# EasyEDA Pro project BMS-Mainboard.epro, board PCB2
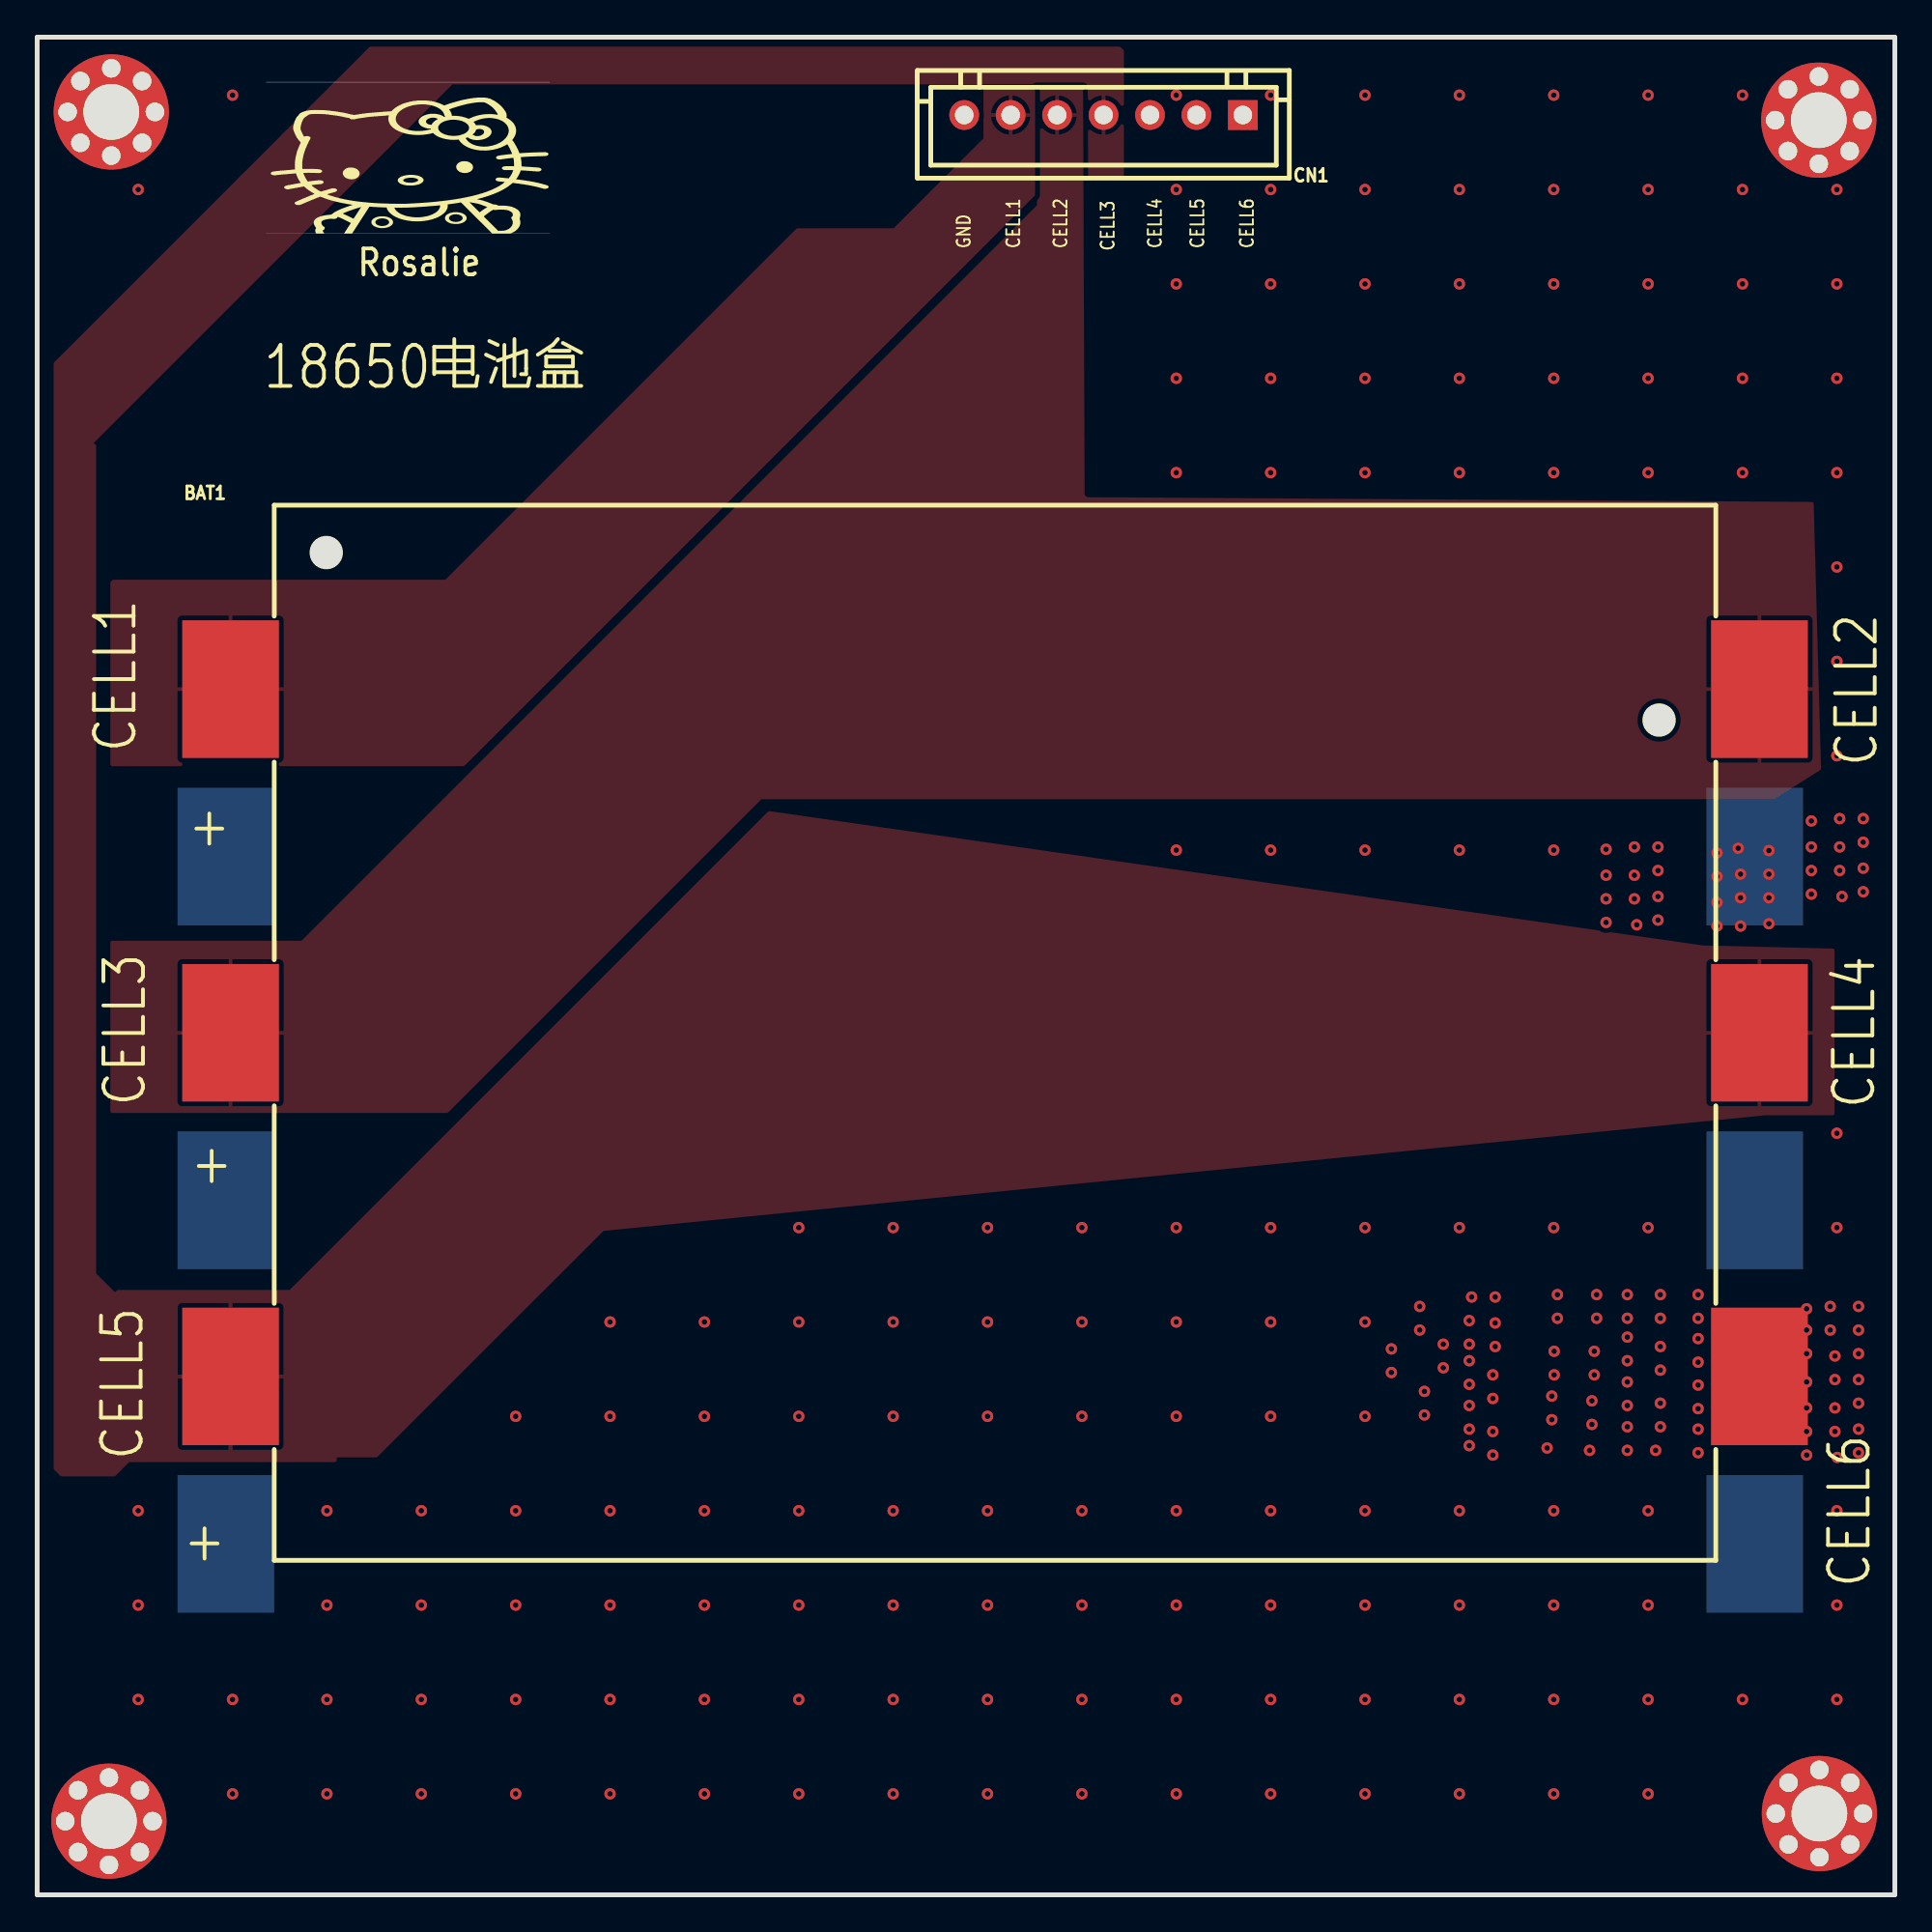
[diagram p9: board, top side]
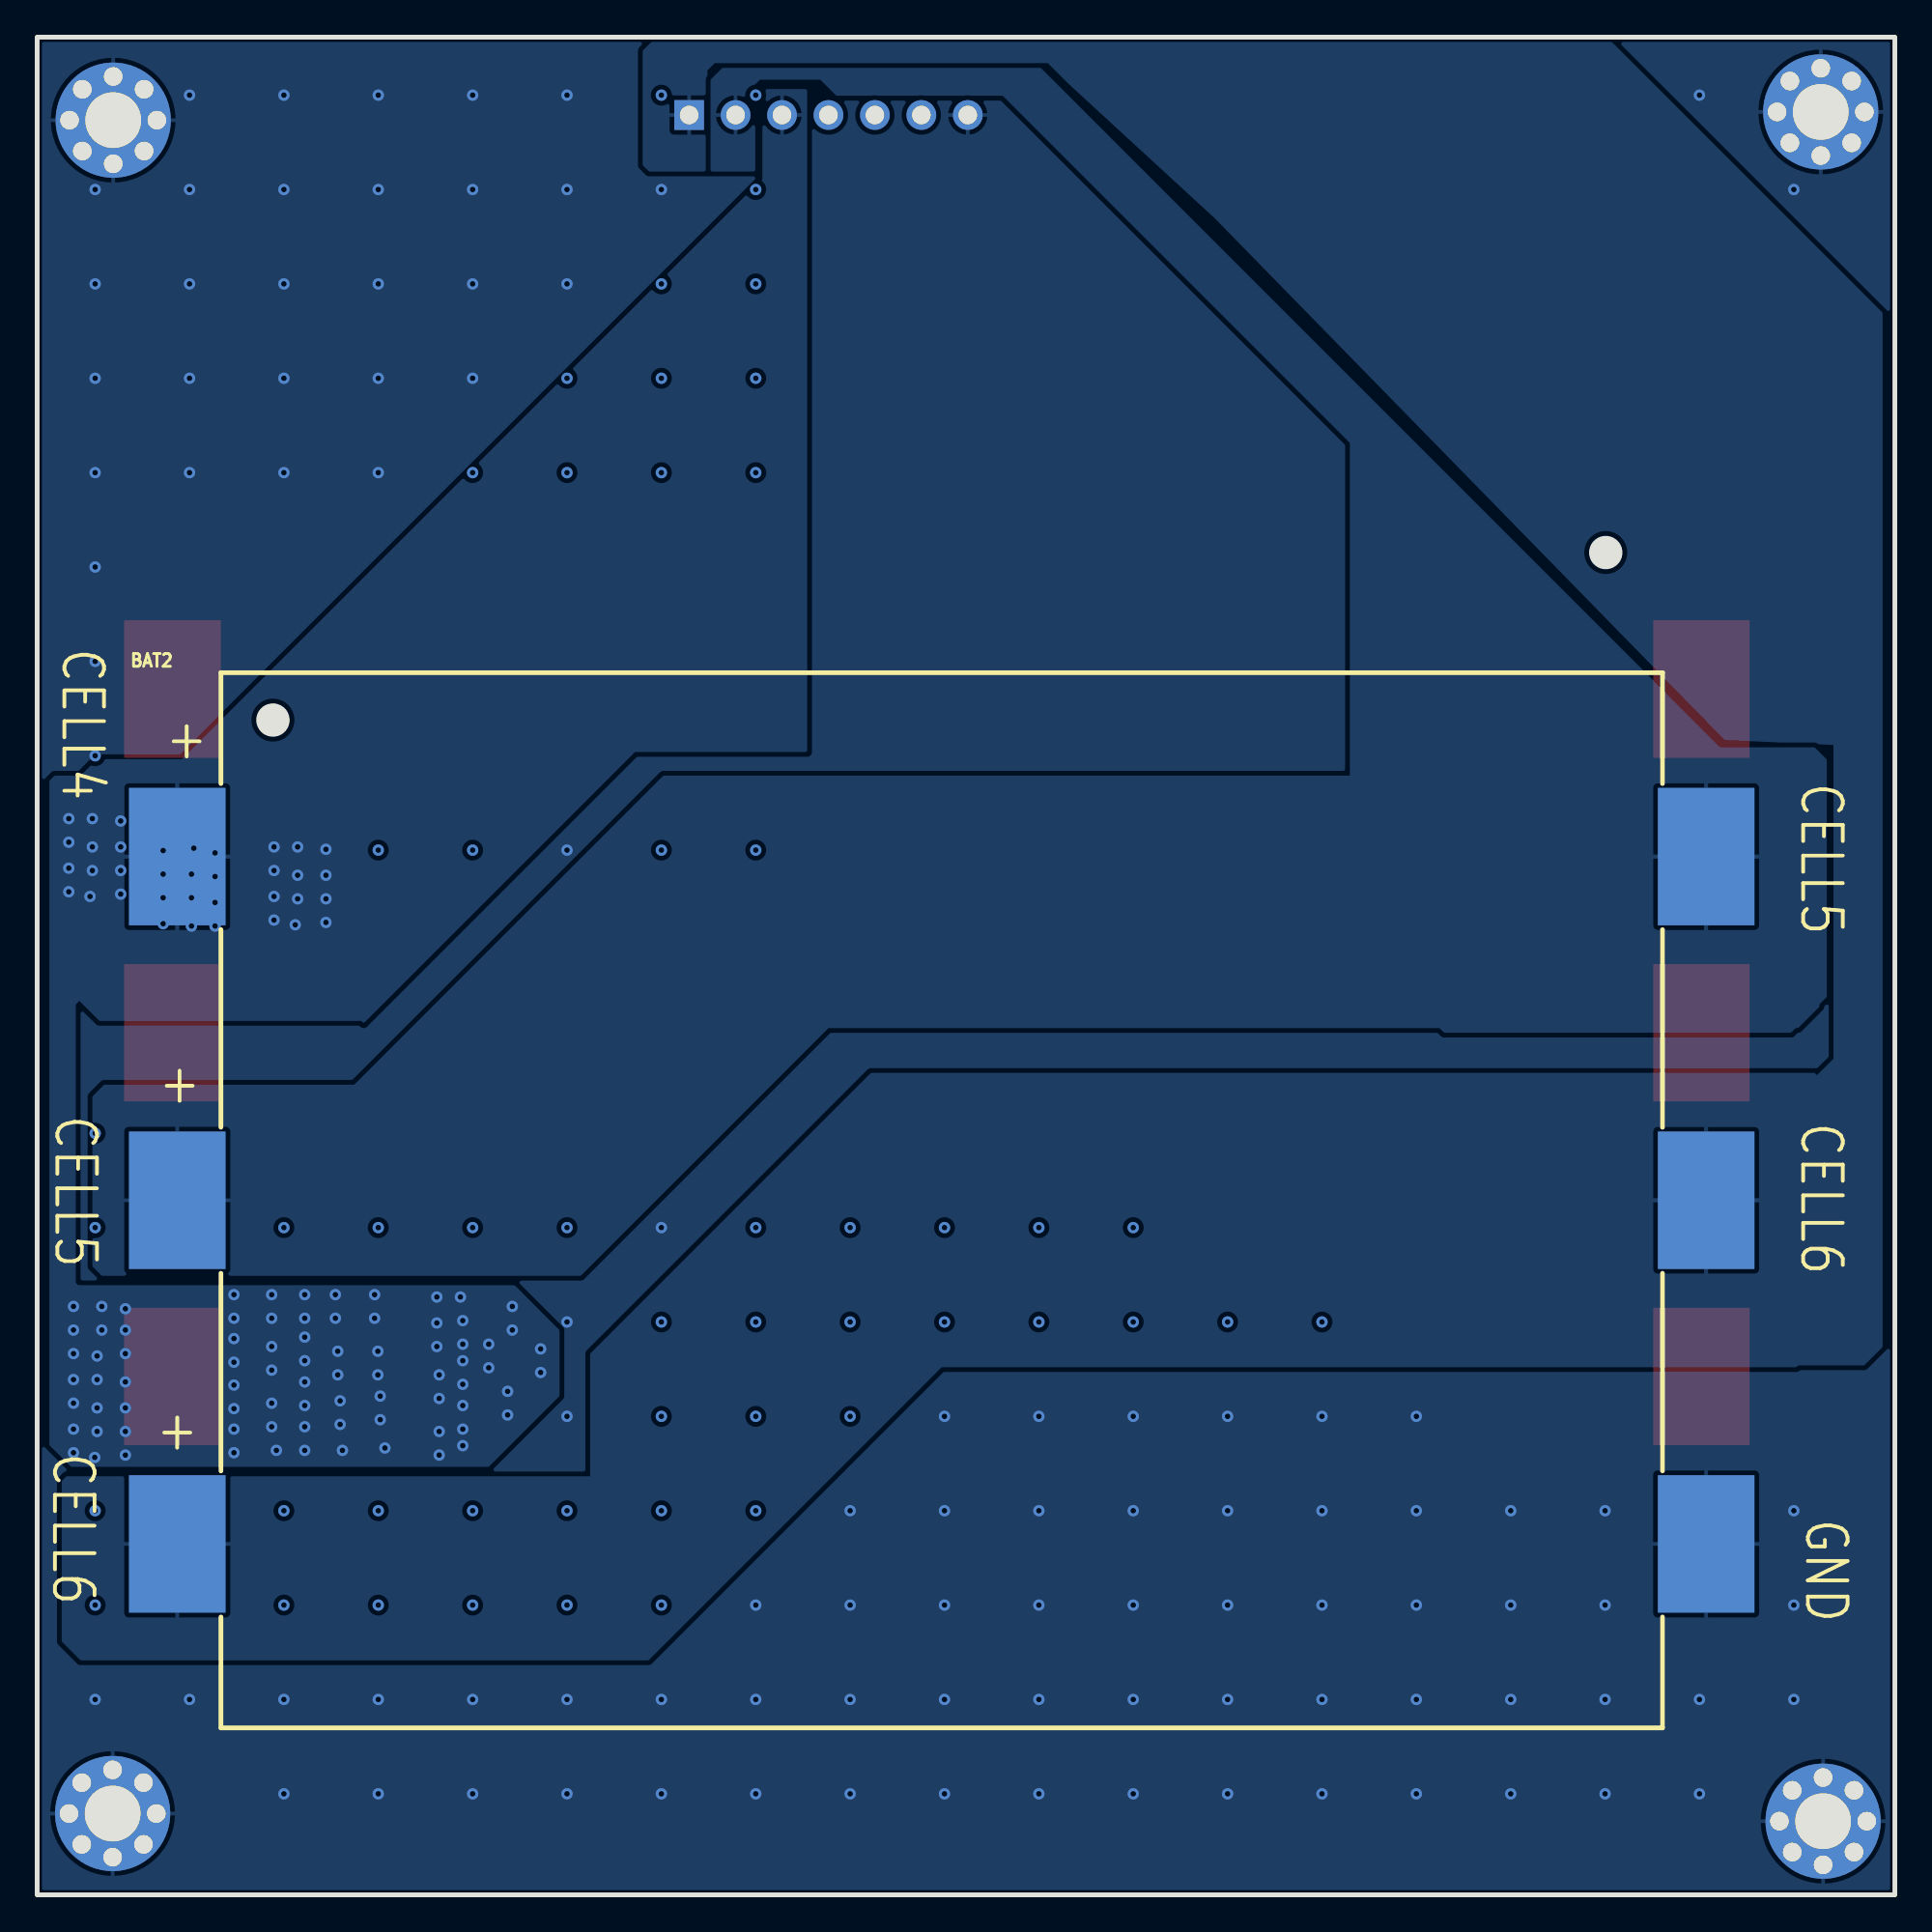
[diagram p10: board, bottom side, seen from below]

Outline 100 x 100 mm; copper layers: Top Layer, Bottom Layer. Coordinates in mm from the lower left corner of the outline.
Outline path: rectangle 0,100 100,0
Stack: Top Layer 0.035mm / Dielectric1 1.51mm FR4 er 4.5 / Bottom Layer 0.035mm

## Design rules (mm)
spacing copperThickness1oz (default): track to track 0.102, other pairs 0.152 to 0.3
spacing copperThickness2oz: track to track 0.203, other pairs 0.152 to 0.3
track width copperThickness1oz (default): min 0.127, default 0.254, max 2.54
track width copperThickness2oz: min 0.203, default 0.254, max 2.54
differential pair differentialPair (default): width min 0.127, default 0.254, max 2.54; gap min 0.152, default 0.152
net CELL1 uses copperRegion
net CELL2 uses copperRegion
net CELL3 uses copperRegion
net CELL4 uses copperRegion
net CELL5 uses copperRegion
net CELL6 uses copperRegion
net GND uses copperRegion

## Placement (name value [footprint] x y rotation side)
BAT1  BH-18650-B5BA016  [BAT-SMD_BH-18650-B5BA016]  51.56 46.41 0 top
BAT2  BH-18650-B5BA016  [BAT-SMD_BH-18650-B5BA016]  51.31 37.39 180 bottom
CN1  ZX-XH2.54-7PZZ-GW  [CONN-TH_7P-P2.50_HCTL_XH-7A]  57.4 95.81 180 top
J1  HDR-M-2.54_1x1  [定位孔]  3.86 3.97 0 top
J2  HDR-M-2.54_1x1  [定位孔]  95.94 4.38 0 top
J3  HDR-M-2.54_1x1  [定位孔]  3.99 95.97 0 top
J4  HDR-M-2.54_1x1  [定位孔]  95.91 95.53 0 top

## Footprints (pads in the part's own frame, mm; a bottom-side part is the same pattern mirrored in y, then rotated)
BAT-SMD_BH-18650-B5BA016
  rect 5.2x7.4 smd: 1(-41.15,18.5) 2(41.15,18.5) 3(-41.15,0) 4(41.15,0) 5(-41.15,-18.5) 6(41.15,-18.5)
CONN-TH_7P-P2.50_HCTL_XH-7A
  rect 1.6x1.6 hole 1: 1(-7.5,0)
  round 1.6 hole 1: 2(-5,0) 3(-2.5,0) 4(0,0) 5(2.5,0) 6(5,0) 7(7.5,0)
定位孔
  round 6.2 hole 3: 1(0,0)
  round 1 hole 1: 2(-1.662,-1.662) 3(-2.35,0) 4(-1.662,1.662) 5(1.662,-1.662) 6(2.35,0) 7(0,2.35) 8(1.662,1.662) 9(0,-2.35)

## Nets
As in the schematic, except:
GND: BAT2.6 CN1.7 J1.1 J1.2 J1.3 J1.4 J1.5 J1.6 J1.7 J1.8 J1.9 J2.1 J2.2 J2.3 J2.4 J2.5 J2.6 J2.7 J2.8 J2.9 J3.1 J3.2 J3.3 J3.4 J3.5 J3.6 J3.7 J3.8 J3.9 J4.1 J4.2 J4.3 J4.4 J4.5 J4.6 J4.7 J4.8 J4.9

## Via types
v1: diameter 0.61, hole 0.305, Top Layer to Bottom Layer, 266 vias

## Routing (per net, layer and track width the routed paths; a pad name or vN(x,y) marks a point on that pad's centre or on a via; arc(x,y) is an arc through that point)
GND:
  vias: v1(5.44,91.8) v1(5.44,20.68) v1(5.44,15.6) v1(5.44,10.52) v1(10.52,96.88) v1(10.52,10.52) v1(10.52,5.44) v1(15.6,20.68) v1(15.6,15.6) v1(15.6,10.52) v1(15.6,5.44) v1(20.68,20.68) v1(20.68,15.6) v1(20.68,10.52) v1(20.68,5.44) v1(25.76,25.76) v1(25.76,20.68) v1(25.76,15.6) v1(25.76,10.52) v1(25.76,5.44) v1(30.84,30.84) v1(30.84,25.76) v1(30.84,20.68) v1(30.84,15.6) v1(30.84,10.52) v1(30.84,5.44) v1(35.92,30.84) v1(35.92,25.76) v1(35.92,20.68) v1(35.92,15.6) v1(35.92,10.52) v1(35.92,5.44) v1(41,35.92) v1(41,30.84) v1(41,25.76) v1(41,20.68) v1(41,15.6) v1(41,10.52) v1(41,5.44) v1(46.08,35.92) v1(46.08,30.84) v1(46.08,25.76) v1(46.08,20.68) v1(46.08,15.6) v1(46.08,10.52) v1(46.08,5.44) v1(51.16,35.92) v1(51.16,30.84) v1(51.16,25.76) v1(51.16,20.68) v1(51.16,15.6) v1(51.16,10.52) v1(51.16,5.44) v1(56.24,35.92) v1(56.24,30.84) v1(56.24,25.76) v1(56.24,20.68) v1(56.24,15.6) v1(56.24,10.52) v1(56.24,5.44) v1(61.32,96.88) v1(61.32,91.8) v1(61.32,86.72) v1(61.32,81.64) v1(61.32,76.56) v1(61.32,56.24) v1(61.32,35.92) v1(61.32,30.84) v1(61.32,25.76) v1(61.32,20.68) v1(61.32,15.6) v1(61.32,10.52) v1(61.32,5.44) v1(66.4,96.88) v1(66.4,91.8) v1(66.4,86.72) v1(66.4,81.64) v1(66.4,76.56) v1(66.4,56.24) v1(66.4,35.92) v1(66.4,30.84) v1(66.4,25.76) v1(66.4,20.68) v1(66.4,15.6) v1(66.4,10.52) v1(66.4,5.44) v1(71.48,96.88) v1(71.48,91.8) v1(71.48,86.72) v1(71.48,81.64) v1(71.48,76.56) v1(71.48,56.24) v1(71.48,35.92) v1(71.48,30.84) v1(71.48,25.76) v1(71.48,20.68) v1(71.48,15.6) v1(71.48,10.52) v1(71.48,5.44) v1(76.56,96.88) v1(76.56,91.8) v1(76.56,86.72) v1(76.56,81.64) v1(76.56,76.56) v1(76.56,56.24) v1(76.56,35.92) v1(76.56,20.68) v1(76.56,15.6) v1(76.56,10.52) v1(76.56,5.44) v1(81.64,96.88) v1(81.64,91.8) v1(81.64,86.72) v1(81.64,81.64) v1(81.64,76.56) v1(81.64,56.24) v1(81.64,35.92) v1(81.64,20.68) v1(81.64,15.6) v1(81.64,10.52) v1(81.64,5.44) v1(86.72,96.88) v1(86.72,91.8) v1(86.72,86.72) v1(86.72,81.64) v1(86.72,76.56) v1(86.72,35.92) v1(86.72,20.68) v1(86.72,15.6) v1(86.72,10.52) v1(86.72,5.44) v1(91.8,96.88) v1(91.8,91.8) v1(91.8,86.72) v1(91.8,81.64) v1(91.8,76.56) v1(91.8,10.52) v1(96.88,91.8) v1(96.88,86.72) v1(96.88,81.64) v1(96.88,76.56) v1(96.88,71.48) v1(96.88,66.4) v1(96.88,61.32) v1(96.88,41) v1(96.88,35.92) v1(96.88,20.68) v1(96.88,15.6) v1(96.88,10.52)
CELL4:
  vias: v1(72.9,29.39) v1(72.9,28.12) v1(74.42,31.67) v1(74.42,30.4) v1(74.68,27.1) v1(74.68,25.83) v1(75.69,29.64) v1(75.69,28.37) v1(77.09,30.91) v1(77.09,29.64) v1(77.09,28.75) v1(77.09,27.48) v1(77.09,26.34) v1(77.09,25.07) v1(77.09,24.18) v1(77.22,32.18) v1(78.36,27.99) v1(78.36,26.72) v1(78.36,24.94) v1(78.36,23.67) v1(78.49,32.18) v1(78.49,30.78) v1(78.49,29.51) v1(81.28,24.05) v1(81.53,26.85) v1(81.53,25.58) v1(81.66,29.26) v1(81.66,27.99) v1(81.84,32.31) v1(81.84,31.04) v1(83.57,23.93) v1(83.69,26.59) v1(83.69,25.32) v1(83.82,29.26) v1(83.82,27.99) v1(83.95,32.31) v1(83.95,31.04) v1(84.46,56.28) v1(84.46,54.89) v1(84.46,53.62) v1(84.46,52.35) v1(85.6,32.31) v1(85.6,31.04) v1(85.6,30.02) v1(85.6,28.75) v1(85.6,27.61) v1(85.6,26.34) v1(85.6,25.2) v1(85.6,23.93) v1(85.98,56.41) v1(85.98,54.89) v1(85.98,53.62) v1(86.11,52.22) v1(87.12,23.93) v1(87.25,56.41) v1(87.25,55.14) v1(87.25,53.74) v1(87.25,52.47) v1(87.38,32.31) v1(87.38,31.04) v1(87.38,29.51) v1(87.38,28.25) v1(87.38,26.47) v1(87.38,25.2) v1(89.41,32.31) v1(89.41,31.04) v1(89.41,29.94) v1(89.41,28.67) v1(89.41,27.44) v1(89.41,26.17) v1(89.41,25.07) v1(89.41,23.8) v1(90.42,56.09) v1(90.42,54.82) v1(90.42,53.42) v1(90.42,52.15) v1(91.57,56.34) v1(91.69,54.94) v1(91.69,53.67) v1(91.69,52.15) v1(93.22,56.21) v1(93.22,54.94) v1(93.22,53.67) v1(93.22,52.28) v1(95.25,31.55) v1(95.25,30.4) v1(95.25,29.13) v1(95.25,27.61) v1(95.25,26.21) v1(95.25,24.94) v1(95.25,23.67) v1(95.5,57.81) v1(95.5,56.41) v1(95.5,55.14) v1(95.5,53.87) v1(96.52,31.67) v1(96.52,30.4) v1(96.77,29.01) v1(96.77,27.74) v1(96.77,26.21) v1(96.77,24.94) v1(96.9,23.55) v1(97.03,57.93) v1(97.03,56.41) v1(97.03,55.14) v1(97.16,53.74) v1(98.04,31.67) v1(98.04,30.4) v1(98.04,29.13) v1(98.04,27.74) v1(98.04,26.47) v1(98.04,25.07) v1(98.04,23.8) v1(98.3,57.93) v1(98.3,56.66) v1(98.3,55.27) v1(98.3,54)

## Copper pours and planes (outline as drawn; the poured copper is in the pictures)
GND on Bottom Layer: 0,100 100,100 100,0 0,0
CELL1 on Top Layer: 4.06,70.79 21.97,70.79 40.89,89.71 46.1,89.71 50.94,94.55 50.94,97.22 53.72,97.22 53.72,91.49 22.99,60.76 3.94,60.76 3.94,70.66
CELL2 on Top Layer: 3.94,51.36 14.22,51.36 53.82,90.96 53.82,97.31 56.3,97.31 56.39,75.36 56.51,75.23 95.63,74.98 96.03,60.57 93.49,58.98 38.99,58.98 22.1,42.09 3.94,42.09
CELL3 on Top Layer: 56.53,92.41 56.48,92.46 56.48,97.46 22.35,97.46 3.05,78.16 3.17,78.03 3.17,33.45 4.19,32.44 4.32,32.56 13.72,32.56 14.22,33.07 15.24,33.07 16.13,32.18 16.13,23.29 4.95,23.29 4.19,22.53 1.27,22.53 0.89,22.91 0.89,82.47 17.91,99.49 58.29,99.49 58.5,99.28 58.5,92.51 58.29,92.51 58.19,92.41
CELL3 on Top Layer: 4.44,32.31 13.33,32.31 39.37,58.34 89.66,51.11 96.75,50.93 96.75,41.96 92.96,41.96 30.48,35.74 18.29,23.55 4.44,23.55
CELL4 on Bottom Layer: 86.11,60.25 99.06,60.25 99.34,59.97 99.34,24.21 98.17,23.04 75.69,23.04 71.88,26.85 71.88,30.4 74.29,32.82 97.79,32.82 97.92,32.94 97.92,47.93 97.54,48.31 85.98,48.31 85.34,48.95 85.34,59.49
CELL4 on Bottom Layer: 58.57,97.21 60.96,97.21 60.96,92.38 92.2,61.14 96.77,61.14 98.93,58.98 98.93,49.33 96.65,47.04 82.55,47.04 82.42,46.91 67.82,61.52 58.55,61.52 58.55,97.18
CELL5 on Bottom Layer: 4.06,60.5 17.65,60.5 17.91,60.25 66.29,60.25 82.93,43.61 96.39,43.61 97.03,42.98 97.03,33.83 96.52,33.33 70.74,33.33 57.4,46.66 5.21,46.66 4.06,47.8
CELL5 on Bottom Layer: 61.34,92.76 61.34,97.46 61.09,97.71 57.85,97.71 56.98,96.84 48.02,96.84 29.34,78.16 29.34,51.49 24.26,46.41 5.59,46.41 3.66,48.33 3.66,61.12 4.32,61.77 9.4,61.77 45.97,98.35 63.12,98.35 63.75,97.71 63.75,92.76
CELL6 on Bottom Layer: 63.88,92.76 63.92,92.8 63.92,98.21 63.52,98.6 45.59,98.6 44.45,97.46 36.58,90.22 9.16,62.17 3.3,61.9 3.3,45.01 4.19,44.12 20.57,44.12 22.1,42.6 22.1,28.88 21.72,28.5 1.65,28.5 0.66,29.49 0.66,85.17 15.24,99.75 66.93,99.75 67.4,99.27 67.4,93.11 67.06,92.76
CELL6 on Bottom Layer: 4.32,44.25 55.12,44.25 70.23,29.13 70.23,22.53 98.43,22.53 98.68,22.28 98.68,13.64 97.66,12.62 67.09,12.62 51.31,28.4 5.3,28.4 4.19,29.51 4.19,44.12

## Text on the board
Bottom Silkscreen Layer: + | GND | CELL5 | CELL6 | CELL4
Top Silkscreen Layer: GND | CELL1 | CELL2 | CELL3 | CELL4 | CELL5 | CELL6 | Rosalie | + | 18650电池盒
